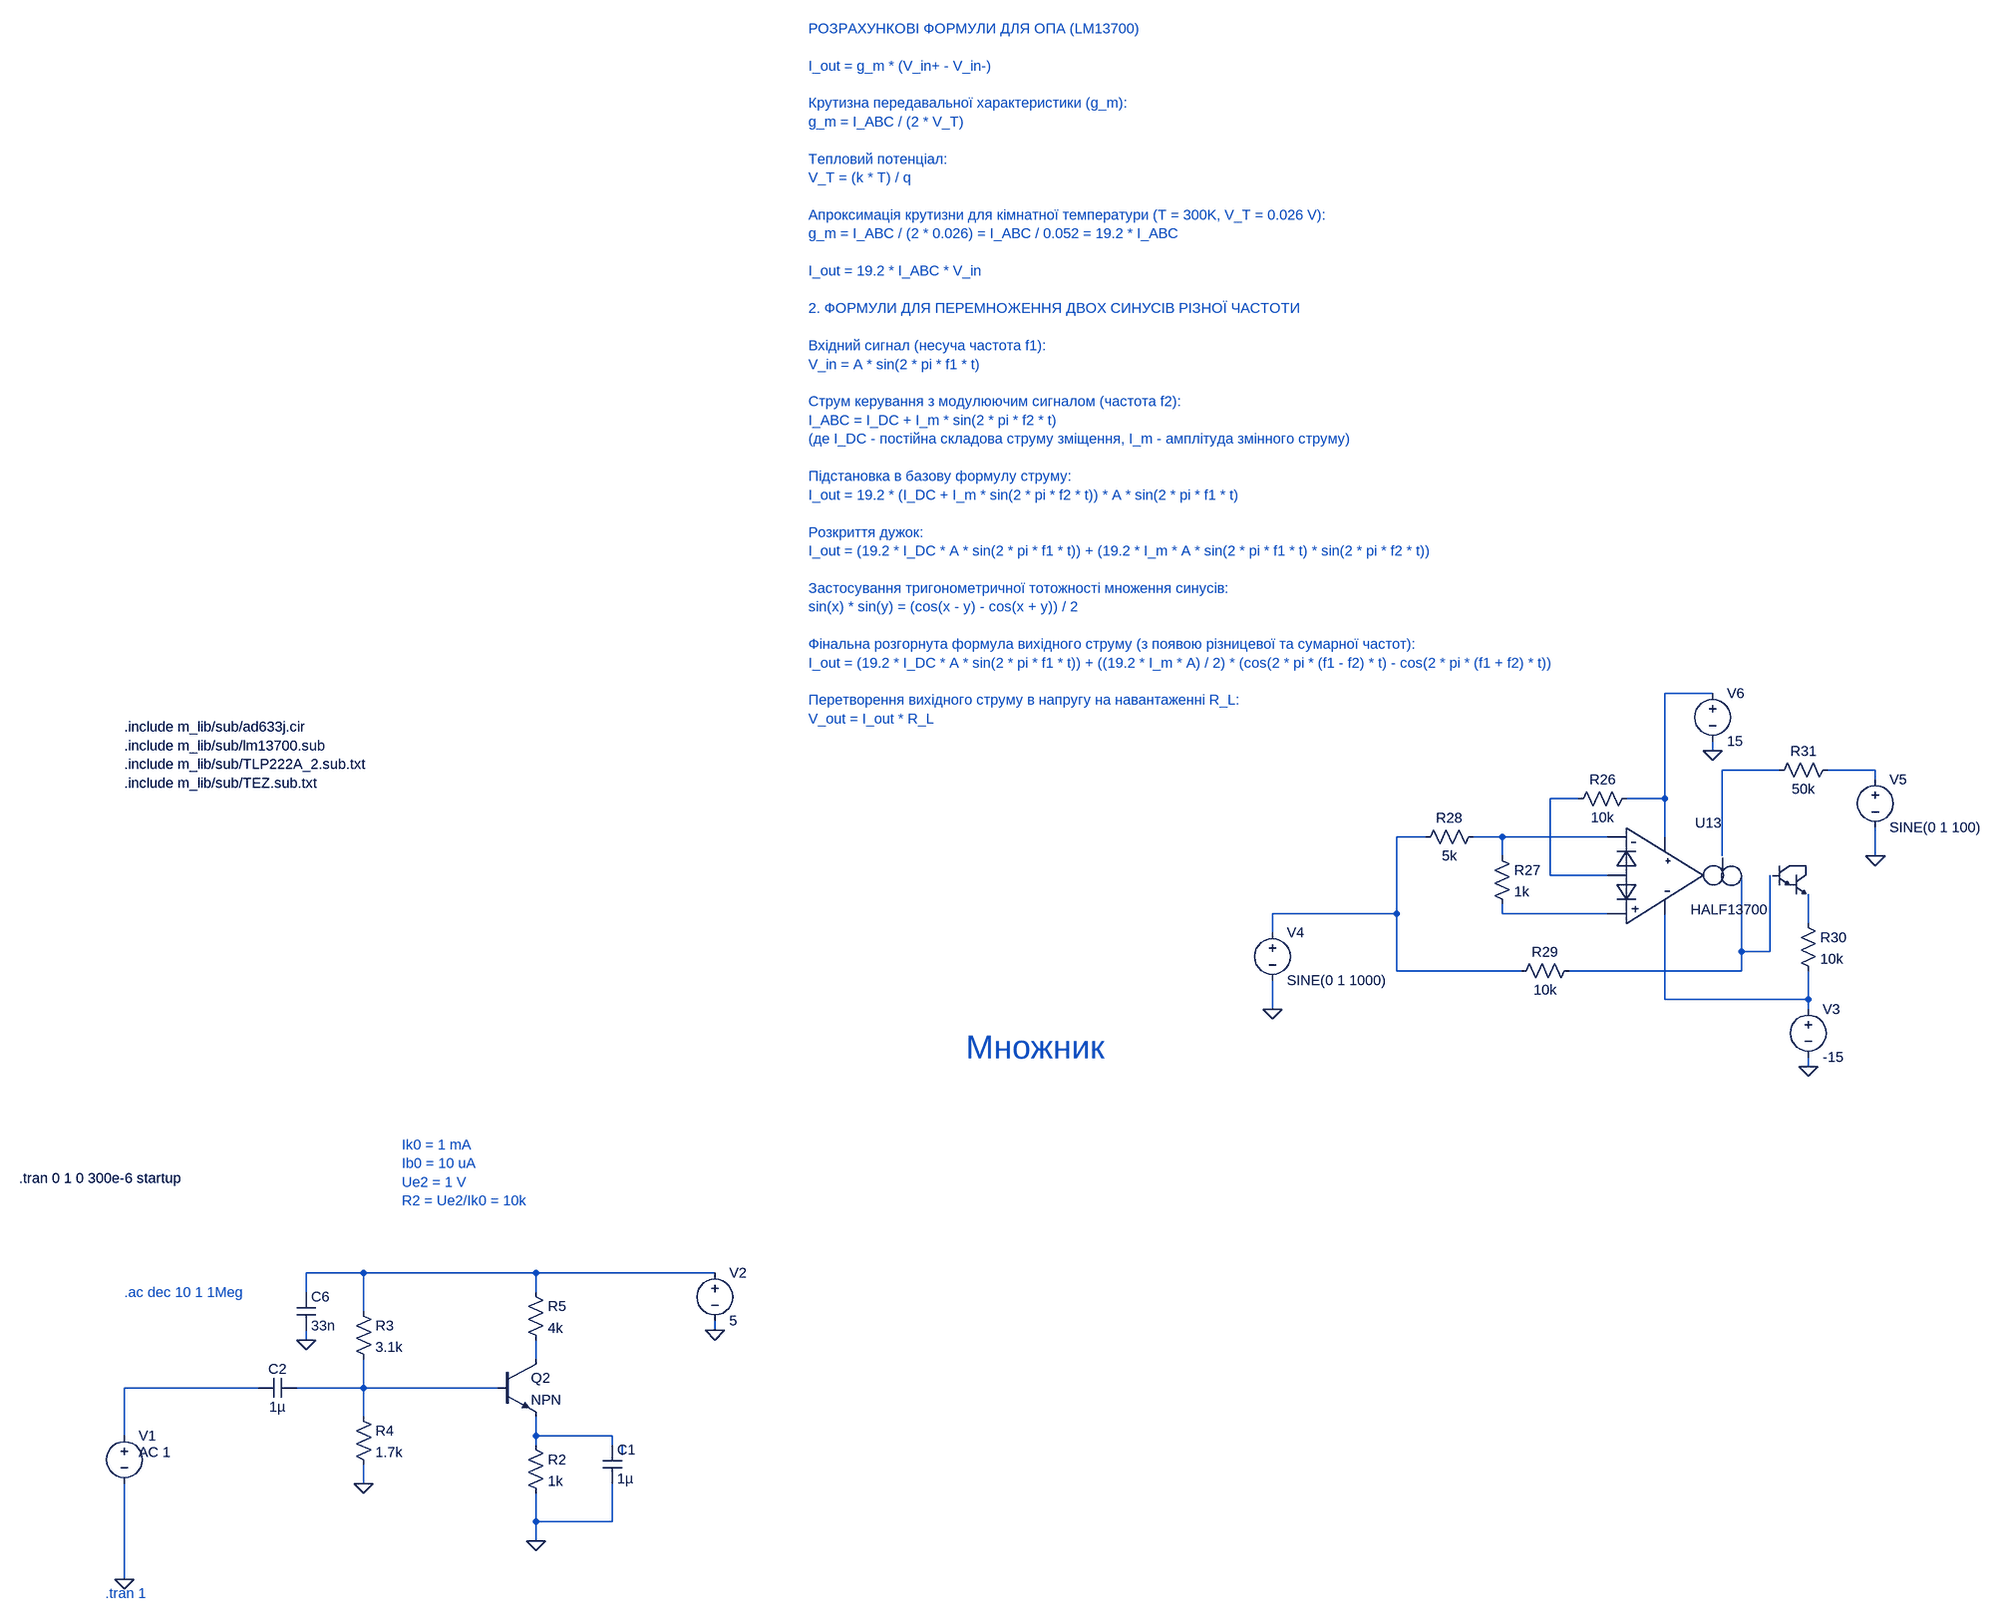
[diagram p0: schematic Draft4.asc]
Draft4.asc, the LTspice schematic file:
Version 4.1
SHEET 1 4484 1448
WIRE 3440 -1440 3360 -1440
WIRE 3440 -1344 3440 -1360
WIRE 3552 -1312 3456 -1312
WIRE 3712 -1312 3632 -1312
WIRE 3712 -1296 3712 -1312
WIRE 3216 -1264 3168 -1264
WIRE 3360 -1264 3360 -1440
WIRE 3360 -1264 3296 -1264
WIRE 2960 -1200 2912 -1200
WIRE 3088 -1200 3040 -1200
WIRE 3264 -1200 3088 -1200
WIRE 3360 -1200 3360 -1264
WIRE 3088 -1168 3088 -1200
WIRE 3456 -1168 3456 -1312
WIRE 3712 -1168 3712 -1216
WIRE 3168 -1136 3168 -1264
WIRE 3264 -1136 3168 -1136
WIRE 2912 -1072 2912 -1200
WIRE 2912 -1072 2704 -1072
WIRE 3088 -1072 3088 -1088
WIRE 3264 -1072 3088 -1072
WIRE 3600 -1056 3600 -1104
WIRE 2704 -1040 2704 -1072
WIRE 3488 -1008 3488 -1136
WIRE 3536 -1008 3536 -1136
WIRE 3536 -1008 3488 -1008
WIRE 2912 -976 2912 -1072
WIRE 3120 -976 2912 -976
WIRE 3488 -976 3488 -1008
WIRE 3488 -976 3200 -976
WIRE 3360 -928 3360 -1072
WIRE 3600 -928 3600 -976
WIRE 3600 -928 3360 -928
WIRE 2704 -912 2704 -960
WIRE 3600 -912 3600 -928
WIRE 3600 -816 3600 -832
WIRE 256 -64 160 -64
WIRE 544 -64 256 -64
WIRE 880 -64 544 -64
WIRE 160 -32 160 -64
WIRE 544 -32 544 -64
WIRE 256 0 256 -64
WIRE 880 32 880 16
WIRE 160 48 160 32
WIRE 544 80 544 48
WIRE 80 128 -144 128
WIRE 256 128 256 80
WIRE 256 128 144 128
WIRE 480 128 256 128
WIRE 256 176 256 128
WIRE -144 208 -144 128
WIRE 544 208 544 176
WIRE 672 208 544 208
WIRE 544 224 544 208
WIRE 672 224 672 208
WIRE 688 240 688 224
WIRE 256 288 256 256
WIRE 544 352 544 304
WIRE 672 352 672 288
WIRE 672 352 544 352
WIRE 544 384 544 352
WIRE -144 448 -144 288
FLAG -144 448 0
FLAG 544 384 0
FLAG 880 32 0
FLAG 256 288 0
FLAG 160 48 0
FLAG 3600 -816 0
FLAG 3712 -1168 0
FLAG 2704 -912 0
FLAG 3440 -1344 0
SYMBOL npn 480 80 R0
SYMATTR InstName Q2
SYMBOL voltage -144 192 R0
WINDOW 3 24 152 Left 2
WINDOW 123 24 44 Left 2
WINDOW 39 0 0 Left 0
SYMATTR Value ""
SYMATTR Value2 AC 1
SYMATTR InstName V1
SYMBOL res 528 208 R0
SYMATTR InstName R2
SYMATTR Value 1k
SYMBOL voltage 880 -80 R0
WINDOW 123 0 0 Left 0
WINDOW 39 0 0 Left 0
SYMATTR InstName V2
SYMATTR Value 5
SYMBOL cap 144 112 R90
WINDOW 0 0 32 VBottom 2
WINDOW 3 32 32 VTop 2
SYMATTR InstName C2
SYMATTR Value 1µ
SYMBOL res 240 -16 R0
SYMATTR InstName R3
SYMATTR Value 3.1k
SYMBOL res 240 160 R0
SYMATTR InstName R4
SYMATTR Value 1.7k
SYMBOL cap 144 -32 R0
SYMATTR InstName C6
SYMATTR Value 33n
SYMBOL res 528 -48 R0
SYMATTR InstName R5
SYMATTR Value 4k
SYMBOL cap 656 224 R0
SYMATTR InstName C1
SYMATTR Value 1µ
SYMBOL LM13700 3328 -1216 R0
SYMATTR InstName U13
SYMBOL res 3072 -1184 R0
SYMATTR InstName R27
SYMATTR Value 1k
SYMBOL res 3056 -1216 R90
WINDOW 0 0 56 VBottom 2
WINDOW 3 32 56 VTop 2
SYMATTR InstName R28
SYMATTR Value 5k
SYMBOL res 3216 -992 R90
WINDOW 0 0 56 VBottom 2
WINDOW 3 32 56 VTop 2
SYMATTR InstName R29
SYMATTR Value 10k
SYMBOL res 3584 -1072 R0
SYMATTR InstName R30
SYMATTR Value 10k
SYMBOL voltage 3600 -928 R0
WINDOW 123 0 0 Left 0
WINDOW 39 0 0 Left 0
SYMATTR InstName V3
SYMATTR Value -15
SYMBOL res 3648 -1328 R90
WINDOW 0 0 56 VBottom 2
WINDOW 3 32 56 VTop 2
SYMATTR InstName R31
SYMATTR Value 50k
SYMBOL voltage 2704 -1056 R0
WINDOW 123 0 0 Left 0
WINDOW 39 0 0 Left 0
SYMATTR InstName V4
SYMATTR Value SINE(0 1 1000)
SYMBOL voltage 3712 -1312 R0
WINDOW 123 0 0 Left 0
WINDOW 39 0 0 Left 0
SYMATTR InstName V5
SYMATTR Value SINE(0 1 100)
SYMBOL voltage 3440 -1456 R0
WINDOW 123 0 0 Left 0
WINDOW 39 0 0 Left 0
SYMATTR InstName V6
SYMATTR Value 15
SYMBOL res 3312 -1280 R90
WINDOW 0 0 56 VBottom 2
WINDOW 3 32 56 VTop 2
SYMATTR InstName R26
SYMATTR Value 10k
TEXT -176 472 Left 2 ;.tran 1
TEXT 320 -280 Left 2 ;Ik0 = 1 mA\nIb0 = 10 uA\nUe2 = 1 V\nR2 = Ue2/Ik0 = 10k
TEXT -144 -32 Left 2 ;.ac dec 10 1 1Meg
TEXT 2192 -848 Left 5 ;Множник
TEXT -144 -1384 Left 2 !.include m_lib/sub/ad633j.cir\n.include m_lib/sub/lm13700.sub\n.include m_lib/sub/TLP222A_2.sub.txt\n.include m_lib/sub/TEZ.sub.txt
TEXT -320 -224 Left 2 !.tran 0 1 0 300e-6 startup
TEXT 1928 -2552 Left 2 ;РОЗРАХУНКОВІ ФОРМУЛИ ДЛЯ ОПА (LM13700)\n \nI_out = g_m * (V_in+ - V_in-)\n \nКрутизна передавальної характеристики (g_m):\ng_m = I_ABC / (2 * V_T)\n \nТепловий потенціал:\nV_T = (k * T) / q\n \nАпроксимація крутизни для кімнатної температури (T = 300K, V_T = 0.026 V):\ng_m = I_ABC / (2 * 0.026) = I_ABC / 0.052 = 19.2 * I_ABC\n \nI_out = 19.2 * I_ABC * V_in\n \n2. ФОРМУЛИ ДЛЯ ПЕРЕМНОЖЕННЯ ДВОХ СИНУСІВ РІЗНОЇ ЧАСТОТИ\n \nВхідний сигнал (несуча частота f1):\nV_in = A * sin(2 * pi * f1 * t)\n \nСтрум керування з модулюючим сигналом (частота f2):\nI_ABC = I_DC + I_m * sin(2 * pi * f2 * t)\n(де I_DC - постійна складова струму зміщення, I_m - амплітуда змінного струму)\n \nПідстановка в базову формулу струму:\nI_out = 19.2 * (I_DC + I_m * sin(2 * pi * f2 * t)) * A * sin(2 * pi * f1 * t)\n \nРозкриття дужок:\nI_out = (19.2 * I_DC * A * sin(2 * pi * f1 * t)) + (19.2 * I_m * A * sin(2 * pi * f1 * t) * sin(2 * pi * f2 * t))\n \nЗастосування тригонометричної тотожності множення синусів:\nsin(x) * sin(y) = (cos(x - y) - cos(x + y)) / 2\n \nФінальна розгорнута формула вихідного струму (з появою різницевої та сумарної частот):\nI_out = (19.2 * I_DC * A * sin(2 * pi * f1 * t)) + ((19.2 * I_m * A) / 2) * (cos(2 * pi * (f1 - f2) * t) - cos(2 * pi * (f1 + f2) * t))\n \nПеретворення вихідного струму в напругу на навантаженні R_L:\nV_out = I_out * R_L

The netlist it stands for:
* Draft4.asc
Q2 N012 N014 N015 0 NPN
V1 N013 0 AC 1
R2 N015 0 1k
V2 N011 0 5
C2 N014 N013 1µ
R3 N011 N014 3.1k
R4 N014 0 1.7k
C6 N011 0 33n
R5 N011 N012 4k
C1 N015 0 1µ
X§U13 N004 N007 N006 N002 N009 N001 N010 N009 N008 HALF13700  ; pins LIN INP INN IAB ? VCC VSS BIN BUF
R27 N006 N007 1k
R28 N006 N005 5k
R29 N009 N005 10k
R30 N008 N010 10k
V3 N010 0 -15
R31 N003 N002 50k
V4 N005 0 SINE(0 1 1000)
V5 N003 0 SINE(0 1 100)
V6 N001 0 15
R26 N001 N004 10k
.model NPN NPN
.model PNP PNP
.lib standard.bjt
* .tran 1
* Ik0 = 1 mA
* Ib0 = 10 uA
* Ue2 = 1 V
* R2 = Ue2/Ik0 = 10k
* .ac dec 10 1 1Meg
* Множник
.include m_lib/sub/ad633j.cir
.include m_lib/sub/lm13700.sub
.include m_lib/sub/TLP222A_2.sub.txt
.include m_lib/sub/TEZ.sub.txt
.tran 0 1 0 300e-6 startup
* РОЗРАХУНКОВІ ФОРМУЛИ ДЛЯ ОПА (LM13700)
* I_out = g_m * (V_in+ - V_in-)
* Крутизна передавальної характеристики (g_m):
* g_m = I_ABC / (2 * V_T)
* Тепловий потенціал:
* V_T = (k * T) / q
* Апроксимація крутизни для кімнатної температури (T = 300K, V_T = 0.026 V):
* g_m = I_ABC / (2 * 0.026) = I_ABC / 0.052 = 19.2 * I_ABC
* I_out = 19.2 * I_ABC * V_in
* 2. ФОРМУЛИ ДЛЯ ПЕРЕМНОЖЕННЯ ДВОХ СИНУСІВ РІЗНОЇ ЧАСТОТИ
* Вхідний сигнал (несуча частота f1):
* V_in = A * sin(2 * pi * f1 * t)
* Струм керування з модулюючим сигналом (частота f2):
* I_ABC = I_DC + I_m * sin(2 * pi * f2 * t)
* (де I_DC - постійна складова струму зміщення, I_m - амплітуда змінного струму)
* Підстановка в базову формулу струму:
* I_out = 19.2 * (I_DC + I_m * sin(2 * pi * f2 * t)) * A * sin(2 * pi * f1 * t)
* Розкриття дужок:
* I_out = (19.2 * I_DC * A * sin(2 * pi * f1 * t)) + (19.2 * I_m * A * sin(2 * pi * f1 * t) * sin(2 * pi * f2 * t))
* Застосування тригонометричної тотожності множення синусів:
* sin(x) * sin(y) = (cos(x - y) - cos(x + y)) / 2
* Фінальна розгорнута формула вихідного струму (з появою різницевої та сумарної частот):
* I_out = (19.2 * I_DC * A * sin(2 * pi * f1 * t)) + ((19.2 * I_m * A) / 2) * (cos(2 * pi * (f1 - f2) * t) - cos(2 * pi * (f1 + f2) * t))
* Перетворення вихідного струму в напругу на навантаженні R_L:
* V_out = I_out * R_L
.backanno
.end